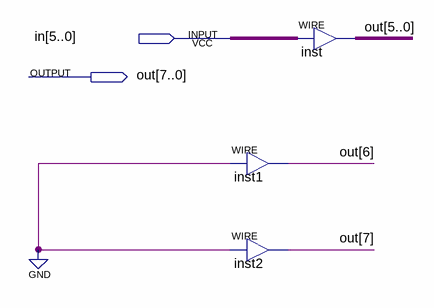
[diagram p0: schematic sheet]
// Quartus schematic normalExtend.bdf as structural Verilog: 3 symbols, 2 pins
module normalExtend (
  input  [5:0] in,
  output [7:0] out
);

  assign out[6] = 1'b0;  // WIRE inst1
  assign out[7] = 1'b0;  // WIRE inst2
  assign out[5:0] = in;  // WIRE inst
endmodule
